# Altium project Main_Board.PrjPcb (part 42 of 44)

## Sheet US_Interrupts.SchDoc
size A3
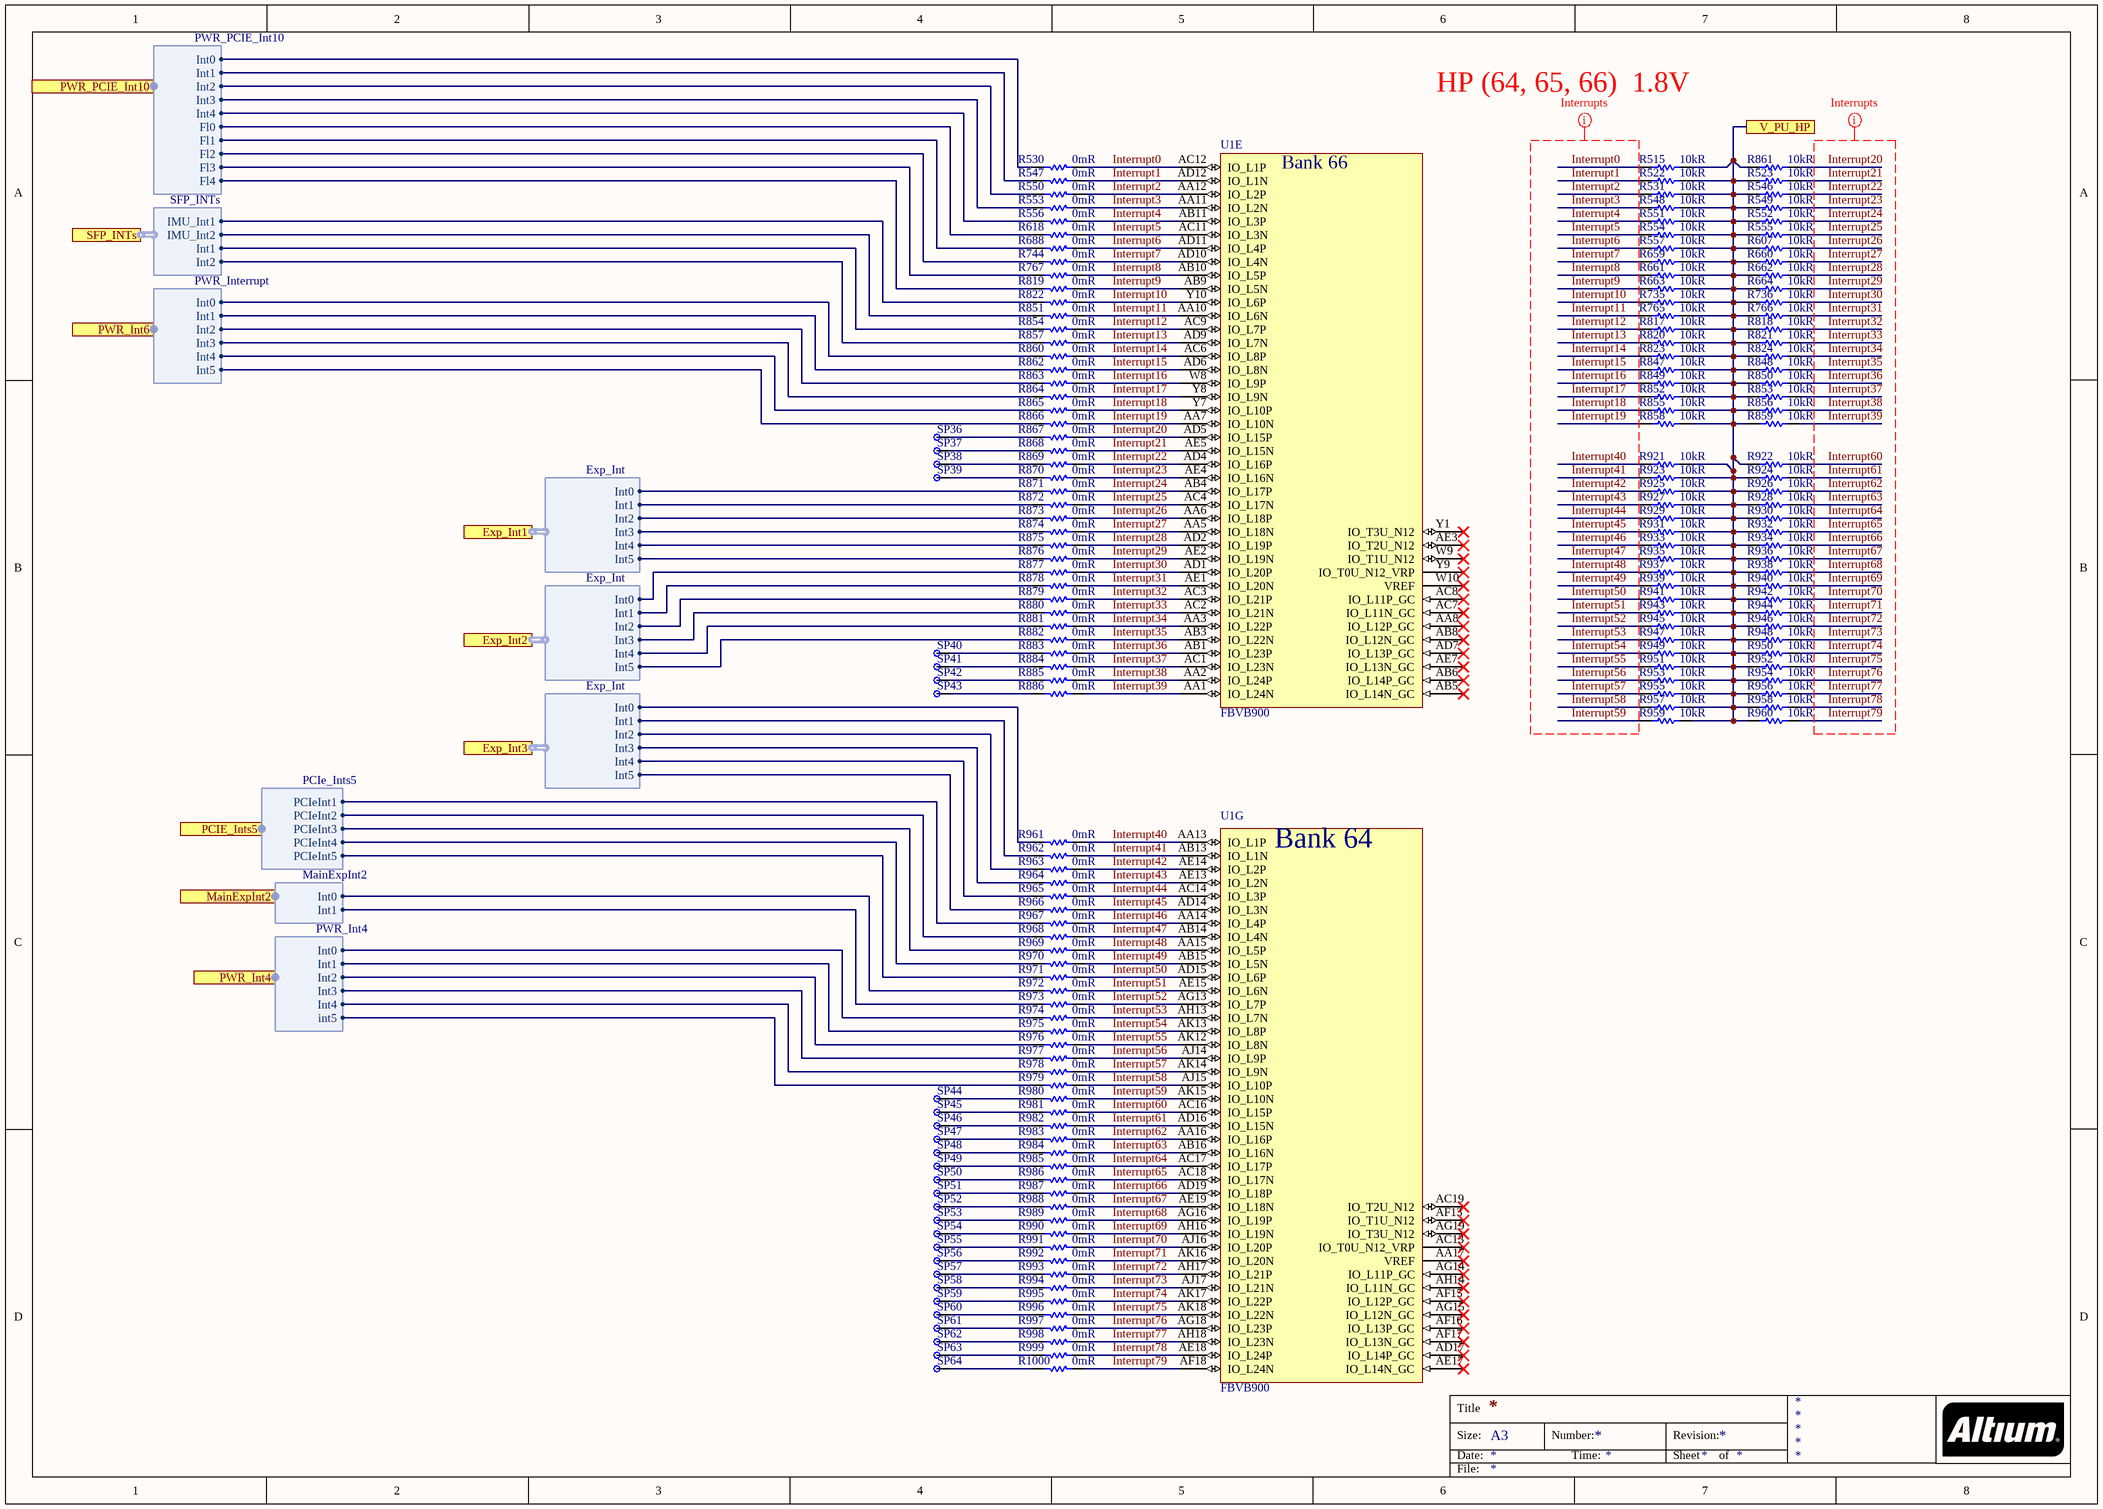
[diagram p69: US_Interrupts.SchDoc]

### Parts
R515  10kR  [RES 0402/1005 RF KK]
R522  10kR  [RES 0402/1005 RF KK]
R523  10kR  [RES 0402/1005 RF KK]
R530  0mR  [RES 0402/1005 RF KK]
R531  10kR  [RES 0402/1005 RF KK]
R546  10kR  [RES 0402/1005 RF KK]
R547  0mR  [RES 0402/1005 RF KK]
R548  10kR  [RES 0402/1005 RF KK]
R549  10kR  [RES 0402/1005 RF KK]
R550  0mR  [RES 0402/1005 RF KK]
R551  10kR  [RES 0402/1005 RF KK]
R552  10kR  [RES 0402/1005 RF KK]
R553  0mR  [RES 0402/1005 RF KK]
R554  10kR  [RES 0402/1005 RF KK]
R555  10kR  [RES 0402/1005 RF KK]
R556  0mR  [RES 0402/1005 RF KK]
R557  10kR  [RES 0402/1005 RF KK]
R607  10kR  [RES 0402/1005 RF KK]
R618  0mR  [RES 0402/1005 RF KK]
R659  10kR  [RES 0402/1005 RF KK]
R660  10kR  [RES 0402/1005 RF KK]
R661  10kR  [RES 0402/1005 RF KK]
R662  10kR  [RES 0402/1005 RF KK]
R663  10kR  [RES 0402/1005 RF KK]
R664  10kR  [RES 0402/1005 RF KK]
R688  0mR  [RES 0402/1005 RF KK]
R735  10kR  [RES 0402/1005 RF KK]
R736  10kR  [RES 0402/1005 RF KK]
R744  0mR  [RES 0402/1005 RF KK]
R765  10kR  [RES 0402/1005 RF KK]
R766  10kR  [RES 0402/1005 RF KK]
R767  0mR  [RES 0402/1005 RF KK]
R817  10kR  [RES 0402/1005 RF KK]
R818  10kR  [RES 0402/1005 RF KK]
R819  0mR  [RES 0402/1005 RF KK]
R820  10kR  [RES 0402/1005 RF KK]
R821  10kR  [RES 0402/1005 RF KK]
R822  0mR  [RES 0402/1005 RF KK]
R823  10kR  [RES 0402/1005 RF KK]
R824  10kR  [RES 0402/1005 RF KK]
R847  10kR  [RES 0402/1005 RF KK]
R848  10kR  [RES 0402/1005 RF KK]
R849  10kR  [RES 0402/1005 RF KK]
R850  10kR  [RES 0402/1005 RF KK]
R851  0mR  [RES 0402/1005 RF KK]
R852  10kR  [RES 0402/1005 RF KK]
R853  10kR  [RES 0402/1005 RF KK]
R854  0mR  [RES 0402/1005 RF KK]
R855  10kR  [RES 0402/1005 RF KK]
R856  10kR  [RES 0402/1005 RF KK]
R857  0mR  [RES 0402/1005 RF KK]
R858  10kR  [RES 0402/1005 RF KK]
R859  10kR  [RES 0402/1005 RF KK]
R860  0mR  [RES 0402/1005 RF KK]
R861  10kR  [RES 0402/1005 RF KK]
R862  0mR  [RES 0402/1005 RF KK]
R863  0mR  [RES 0402/1005 RF KK]
R864  0mR  [RES 0402/1005 RF KK]
R865  0mR  [RES 0402/1005 RF KK]
R866  0mR  [RES 0402/1005 RF KK]
R867  0mR  [RES 0402/1005 RF KK]
R868  0mR  [RES 0402/1005 RF KK]
R869  0mR  [RES 0402/1005 RF KK]
R870  0mR  [RES 0402/1005 RF KK]
R871  0mR  [RES 0402/1005 RF KK]
R872  0mR  [RES 0402/1005 RF KK]
R873  0mR  [RES 0402/1005 RF KK]
R874  0mR  [RES 0402/1005 RF KK]
R875  0mR  [RES 0402/1005 RF KK]
R876  0mR  [RES 0402/1005 RF KK]
R877  0mR  [RES 0402/1005 RF KK]
R878  0mR  [RES 0402/1005 RF KK]
R879  0mR  [RES 0402/1005 RF KK]
R880  0mR  [RES 0402/1005 RF KK]
R881  0mR  [RES 0402/1005 RF KK]
R882  0mR  [RES 0402/1005 RF KK]
R883  0mR  [RES 0402/1005 RF KK]
R884  0mR  [RES 0402/1005 RF KK]
R885  0mR  [RES 0402/1005 RF KK]
R886  0mR  [RES 0402/1005 RF KK]
R921  10kR  [RES 0402/1005 RF KK]
R922  10kR  [RES 0402/1005 RF KK]
R923  10kR  [RES 0402/1005 RF KK]
R924  10kR  [RES 0402/1005 RF KK]
R925  10kR  [RES 0402/1005 RF KK]
R926  10kR  [RES 0402/1005 RF KK]
R927  10kR  [RES 0402/1005 RF KK]
R928  10kR  [RES 0402/1005 RF KK]
R929  10kR  [RES 0402/1005 RF KK]
R930  10kR  [RES 0402/1005 RF KK]
R931  10kR  [RES 0402/1005 RF KK]
R932  10kR  [RES 0402/1005 RF KK]
R933  10kR  [RES 0402/1005 RF KK]
R934  10kR  [RES 0402/1005 RF KK]
R935  10kR  [RES 0402/1005 RF KK]
R936  10kR  [RES 0402/1005 RF KK]
R937  10kR  [RES 0402/1005 RF KK]
R938  10kR  [RES 0402/1005 RF KK]
R939  10kR  [RES 0402/1005 RF KK]
R940  10kR  [RES 0402/1005 RF KK]
R941  10kR  [RES 0402/1005 RF KK]
R942  10kR  [RES 0402/1005 RF KK]
R943  10kR  [RES 0402/1005 RF KK]
R944  10kR  [RES 0402/1005 RF KK]
R945  10kR  [RES 0402/1005 RF KK]
R946  10kR  [RES 0402/1005 RF KK]
R947  10kR  [RES 0402/1005 RF KK]
R948  10kR  [RES 0402/1005 RF KK]
R949  10kR  [RES 0402/1005 RF KK]
R950  10kR  [RES 0402/1005 RF KK]
R951  10kR  [RES 0402/1005 RF KK]
R952  10kR  [RES 0402/1005 RF KK]
R953  10kR  [RES 0402/1005 RF KK]
R954  10kR  [RES 0402/1005 RF KK]
R955  10kR  [RES 0402/1005 RF KK]
R956  10kR  [RES 0402/1005 RF KK]
R957  10kR  [RES 0402/1005 RF KK]
R958  10kR  [RES 0402/1005 RF KK]
R959  10kR  [RES 0402/1005 RF KK]
R960  10kR  [RES 0402/1005 RF KK]
R961  0mR  [RES 0402/1005 RF KK]
R962  0mR  [RES 0402/1005 RF KK]
R963  0mR  [RES 0402/1005 RF KK]
R964  0mR  [RES 0402/1005 RF KK]
R965  0mR  [RES 0402/1005 RF KK]
R966  0mR  [RES 0402/1005 RF KK]
R967  0mR  [RES 0402/1005 RF KK]
R968  0mR  [RES 0402/1005 RF KK]
R969  0mR  [RES 0402/1005 RF KK]
R970  0mR  [RES 0402/1005 RF KK]
R971  0mR  [RES 0402/1005 RF KK]
R972  0mR  [RES 0402/1005 RF KK]
R973  0mR  [RES 0402/1005 RF KK]
R974  0mR  [RES 0402/1005 RF KK]
R975  0mR  [RES 0402/1005 RF KK]
R976  0mR  [RES 0402/1005 RF KK]
R977  0mR  [RES 0402/1005 RF KK]
R978  0mR  [RES 0402/1005 RF KK]
R979  0mR  [RES 0402/1005 RF KK]
R980  0mR  [RES 0402/1005 RF KK]
R981  0mR  [RES 0402/1005 RF KK]
R982  0mR  [RES 0402/1005 RF KK]
R983  0mR  [RES 0402/1005 RF KK]
R984  0mR  [RES 0402/1005 RF KK]
R985  0mR  [RES 0402/1005 RF KK]
R986  0mR  [RES 0402/1005 RF KK]
R987  0mR  [RES 0402/1005 RF KK]
R988  0mR  [RES 0402/1005 RF KK]
R989  0mR  [RES 0402/1005 RF KK]
R990  0mR  [RES 0402/1005 RF KK]
R991  0mR  [RES 0402/1005 RF KK]
R992  0mR  [RES 0402/1005 RF KK]
R993  0mR  [RES 0402/1005 RF KK]
R994  0mR  [RES 0402/1005 RF KK]
R995  0mR  [RES 0402/1005 RF KK]
R996  0mR  [RES 0402/1005 RF KK]
R997  0mR  [RES 0402/1005 RF KK]
R998  0mR  [RES 0402/1005 RF KK]
R999  0mR  [RES 0402/1005 RF KK]
R1000  0mR  [RES 0402/1005 RF KK]
SP36  SP  [MeasureTP]  (value not drawn)
SP37  SP  [MeasureTP]  (value not drawn)
SP38  SP  [MeasureTP]  (value not drawn)
SP39  SP  [MeasureTP]  (value not drawn)
SP40  SP  [MeasureTP]  (value not drawn)
SP41  SP  [MeasureTP]  (value not drawn)
SP42  SP  [MeasureTP]  (value not drawn)
SP43  SP  [MeasureTP]  (value not drawn)
SP44  SP  [MeasureTP]  (value not drawn)
SP45  SP  [MeasureTP]  (value not drawn)
SP46  SP  [MeasureTP]  (value not drawn)
SP47  SP  [MeasureTP]  (value not drawn)
SP48  SP  [MeasureTP]  (value not drawn)
SP49  SP  [MeasureTP]  (value not drawn)
SP50  SP  [MeasureTP]  (value not drawn)
SP51  SP  [MeasureTP]  (value not drawn)
SP52  SP  [MeasureTP]  (value not drawn)
SP53  SP  [MeasureTP]  (value not drawn)
SP54  SP  [MeasureTP]  (value not drawn)
SP55  SP  [MeasureTP]  (value not drawn)
SP56  SP  [MeasureTP]  (value not drawn)
SP57  SP  [MeasureTP]  (value not drawn)
SP58  SP  [MeasureTP]  (value not drawn)
SP59  SP  [MeasureTP]  (value not drawn)
SP60  SP  [MeasureTP]  (value not drawn)
SP61  SP  [MeasureTP]  (value not drawn)
SP62  SP  [MeasureTP]  (value not drawn)
SP63  SP  [MeasureTP]  (value not drawn)
SP64  SP  [MeasureTP]  (value not drawn)
U1  FBVB900  [FBVB900 XX]  (parts E,G of 23)

### Ports
Exp_Int1 (harness Exp_Int), Exp_Int2 (harness Exp_Int), Exp_Int3 (harness Exp_Int), MainExpInt2 (harness MainExpInt2), PCIE_Ints5 (harness PCIe_Ints5), PWR_Int4 (harness PWR_Int4), PWR_Int6 (harness PWR_Interrupt), PWR_PCIE_Int10 (harness PWR_PCIE_Int10), SFP_INTs (harness SFP_INTs), V_PU_HP

### Harnesses
PWR_Interrupt: Int0, Int1, Int2, Int3, Int4, Int5
Exp_Int: Int0, Int1, Int2, Int3, Int4, Int5
PCIe_Ints5: PCIeInt1, PCIeInt2, PCIeInt3, PCIeInt4, PCIeInt5
MainExpInt2: Int0, Int1
PWR_PCIE_Int10: Int0, Int1, Int2, Int3, Int4, Fl0, Fl1, Fl2, Fl3, Fl4
SFP_INTs: IMU_Int1, Int1, Int2, IMU_Int2
PWR_Int4: Int0, Int1, Int2, Int3, Int4, int5

### Nets
Flag_PWRSwitch_PCIE0: R618.2 ; port PWR_PCIE_Int10.Fl0
Flag_PWRSwitch_PCIE1: R688.2 ; port PWR_PCIE_Int10.Fl1
Flag_PWRSwitch_PCIE2: R744.2 ; port PWR_PCIE_Int10.Fl2
Flag_PWRSwitch_PCIE3: R767.2 ; port PWR_PCIE_Int10.Fl3
Flag_PWRSwitch_PCIE4: R819.2 ; port PWR_PCIE_Int10.Fl4
GPIO_Exp10_Int0: R871.2 ; port Exp_Int1.Int0
GPIO_Exp10_Int1: R872.2 ; port Exp_Int1.Int1
GPIO_Exp11_Int0: R873.2 ; port Exp_Int1.Int2
GPIO_Exp11_Int1: R874.2 ; port Exp_Int1.Int3
GPIO_Exp12_Int0: R875.2 ; port Exp_Int1.Int4
GPIO_Exp12_Int1: R876.2 ; port Exp_Int1.Int5
GPIO_Exp13_Int0: R877.2 ; port Exp_Int2.Int0
GPIO_Exp13_Int1: R878.2 ; port Exp_Int2.Int1
GPIO_Exp14_Int0: R879.2 ; port Exp_Int2.Int2
GPIO_Exp14_Int1: R880.2 ; port Exp_Int2.Int3
GPIO_Exp15_Int0: R881.2 ; port Exp_Int2.Int4
GPIO_Exp15_Int1: R882.2 ; port Exp_Int2.Int5
IMU_INT1: R822.2 ; port SFP_INTs.IMU_Int1
IMU_INT2: R851.2 ; port SFP_INTs.IMU_Int2
INTA_EXP_MAIN: R972.2 ; port MainExpInt2.Int0
INTB_EXP_MAIN: R973.2 ; port MainExpInt2.Int1
Interrupt0: R515.2 R530.1 U1.AC12(IO_L1P)
Interrupt1: R522.2 R547.1 U1.AD12(IO_L1N)
Interrupt2: R531.2 R550.1 U1.AA12(IO_L2P)
Interrupt3: R548.2 R553.1 U1.AA11(IO_L2N)
Interrupt4: R551.2 R556.1 U1.AB11(IO_L3P)
Interrupt5: R554.2 R618.1 U1.AC11(IO_L3N)
Interrupt6: R557.2 R688.1 U1.AD11(IO_L4P)
Interrupt7: R659.2 R744.1 U1.AD10(IO_L4N)
Interrupt8: R661.2 R767.1 U1.AB10(IO_L5P)
Interrupt9: R663.2 R819.1 U1.AB9(IO_L5N)
Interrupt10: R735.2 R822.1 U1.Y10(IO_L6P)
Interrupt11: R765.2 R851.1 U1.AA10(IO_L6N)
Interrupt12: R817.2 R854.1 U1.AC9(IO_L7P)
Interrupt13: R820.2 R857.1 U1.AD9(IO_L7N)
Interrupt14: R823.2 R860.1 U1.AC6(IO_L8P)
Interrupt15: R847.2 R862.1 U1.AD6(IO_L8N)
Interrupt16: R849.2 R863.1 U1.W8(IO_L9P)
Interrupt17: R852.2 R864.1 U1.Y8(IO_L9N)
Interrupt18: R855.2 R865.1 U1.Y7(IO_L10P)
Interrupt19: R858.2 R866.1 U1.AA7(IO_L10N)
Interrupt20: R861.1 R867.1 U1.AD5(IO_L15P)
Interrupt21: R523.1 R868.1 U1.AE5(IO_L15N)
Interrupt22: R546.1 R869.1 U1.AD4(IO_L16P)
Interrupt23: R549.1 R870.1 U1.AE4(IO_L16N)
Interrupt24: R552.1 R871.1 U1.AB4(IO_L17P)
Interrupt25: R555.1 R872.1 U1.AC4(IO_L17N)
Interrupt26: R607.1 R873.1 U1.AA6(IO_L18P)
Interrupt27: R660.1 R874.1 U1.AA5(IO_L18N)
Interrupt28: R662.1 R875.1 U1.AD2(IO_L19P)
Interrupt29: R664.1 R876.1 U1.AE2(IO_L19N)
Interrupt30: R736.1 R877.1 U1.AD1(IO_L20P)
Interrupt31: R766.1 R878.1 U1.AE1(IO_L20N)
Interrupt32: R818.1 R879.1 U1.AC3(IO_L21P)
Interrupt33: R821.1 R880.1 U1.AC2(IO_L21N)
Interrupt34: R824.1 R881.1 U1.AA3(IO_L22P)
Interrupt35: R848.1 R882.1 U1.AB3(IO_L22N)
Interrupt36: R850.1 R883.1 U1.AB1(IO_L23P)
Interrupt37: R853.1 R884.1 U1.AC1(IO_L23N)
Interrupt38: R856.1 R885.1 U1.AA2(IO_L24P)
Interrupt39: R859.1 R886.1 U1.AA1(IO_L24N)
Interrupt40: R921.2 R961.1 U1.AA13(IO_L1P)
Interrupt41: R923.2 R962.1 U1.AB13(IO_L1N)
Interrupt42: R925.2 R963.1 U1.AE14(IO_L2P)
Interrupt43: R927.2 R964.1 U1.AE13(IO_L2N)
Interrupt44: R929.2 R965.1 U1.AC14(IO_L3P)
Interrupt45: R931.2 R966.1 U1.AD14(IO_L3N)
Interrupt46: R933.2 R967.1 U1.AA14(IO_L4P)
Interrupt47: R935.2 R968.1 U1.AB14(IO_L4N)
Interrupt48: R937.2 R969.1 U1.AA15(IO_L5P)
Interrupt49: R939.2 R970.1 U1.AB15(IO_L5N)
Interrupt50: R941.2 R971.1 U1.AD15(IO_L6P)
Interrupt51: R943.2 R972.1 U1.AE15(IO_L6N)
Interrupt52: R945.2 R973.1 U1.AG13(IO_L7P)
Interrupt53: R947.2 R974.1 U1.AH13(IO_L7N)
Interrupt54: R949.2 R975.1 U1.AK13(IO_L8P)
Interrupt55: R951.2 R976.1 U1.AK12(IO_L8N)
Interrupt56: R953.2 R977.1 U1.AJ14(IO_L9P)
Interrupt57: R955.2 R978.1 U1.AK14(IO_L9N)
Interrupt58: R957.2 R979.1 U1.AJ15(IO_L10P)
Interrupt59: R959.2 R980.1 U1.AK15(IO_L10N)
Interrupt60: R922.1 R981.1 U1.AC16(IO_L15P)
Interrupt61: R924.1 R982.1 U1.AD16(IO_L15N)
Interrupt62: R926.1 R983.1 U1.AA16(IO_L16P)
Interrupt63: R928.1 R984.1 U1.AB16(IO_L16N)
Interrupt64: R930.1 R985.1 U1.AC17(IO_L17P)
Interrupt65: R932.1 R986.1 U1.AC18(IO_L17N)
Interrupt66: R934.1 R987.1 U1.AD19(IO_L18P)
Interrupt67: R936.1 R988.1 U1.AE19(IO_L18N)
Interrupt68: R938.1 R989.1 U1.AG16(IO_L19P)
Interrupt69: R940.1 R990.1 U1.AH16(IO_L19N)
Interrupt70: R942.1 R991.1 U1.AJ16(IO_L20P)
Interrupt71: R944.1 R992.1 U1.AK16(IO_L20N)
Interrupt72: R946.1 R993.1 U1.AH17(IO_L21P)
Interrupt73: R948.1 R994.1 U1.AJ17(IO_L21N)
Interrupt74: R950.1 R995.1 U1.AK17(IO_L22P)
Interrupt75: R952.1 R996.1 U1.AK18(IO_L22N)
Interrupt76: R954.1 R997.1 U1.AG18(IO_L23P)
Interrupt77: R956.1 R998.1 U1.AH18(IO_L23N)
Interrupt78: R958.1 R999.1 U1.AE18(IO_L24P)
Interrupt79: R960.1 R1000.1 U1.AF18(IO_L24N)
P4HS_PowerAlert_Pcie0: R530.2 ; port PWR_PCIE_Int10.Int0
P4HS_PowerAlert_Pcie1: R547.2 ; port PWR_PCIE_Int10.Int1
P4HS_PowerAlert_Pcie2: R550.2 ; port PWR_PCIE_Int10.Int2
P4HS_PowerAlert_Pcie3: R553.2 ; port PWR_PCIE_Int10.Int3
P4HS_PowerAlert_Pcie4: R556.2 ; port PWR_PCIE_Int10.Int4
PWR_ExtIO_INT0: R977.2 ; port PWR_Int4.Int3
PWR_ExtIO_INT1: R976.2 ; port PWR_Int4.Int2
PWR_ExtIO_INT2: R978.2 ; port PWR_Int4.Int4
PWR_ExtIO_INT3: R979.2 ; port PWR_Int4.int5
PWR_PowerAlert0: R974.2 ; port PWR_Int4.Int0
PWR_PowerAlert1: R975.2 ; port PWR_Int4.Int1
SFP_INT0: R854.2 ; port SFP_INTs.Int1
SFP_INT1: R857.2 ; port SFP_INTs.Int2
US+_MGTVccAux: R515.1 R522.1 R523.2 R531.1 R546.2 R548.1 R549.2 R551.1 R552.2 R554.1 R555.2 R557.1 R607.2 R659.1 R660.2 R661.1 R662.2 R663.1 R664.2 R735.1 R736.2 R765.1 R766.2 R817.1 R818.2 R820.1 R821.2 R823.1 R824.2 R847.1 R848.2 R849.1 R850.2 R852.1 R853.2 R855.1 R856.2 R858.1 R859.2 R861.2 R921.1 R922.2 R923.1 R924.2 R925.1 R926.2 R927.1 R928.2 R929.1 R930.2 R931.1 R932.2 R933.1 R934.2 R935.1 R936.2 R937.1 R938.2 R939.1 R940.2 R941.1 R942.2 R943.1 R944.2 R945.1 R946.2 R947.1 R948.2 R949.1 R950.2 R951.1 R952.2 R953.1 R954.2 R955.1 R956.2 R957.1 R958.2 R959.1 R960.2 ; port V_PU_HP
NetJ1_PCIE0_43: R967.2 ; port PCIE_Ints5.PCIeInt1
NetJ1_PCIE1_43: R968.2 ; port PCIE_Ints5.PCIeInt2
NetJ1_PCIE2_43: R969.2 ; port PCIE_Ints5.PCIeInt3
NetJ1_PCIE3_43: R970.2 ; port PCIE_Ints5.PCIeInt4
NetJ1_PCIE4_43: R971.2 ; port PCIE_Ints5.PCIeInt5
NetR860_2: R860.2 ; port PWR_Int6.Int0
NetR862_2: R862.2 ; port PWR_Int6.Int1
NetR863_2: R863.2 ; port PWR_Int6.Int2
NetR864_2: R864.2 ; port PWR_Int6.Int3
NetR865_2: R865.2 ; port PWR_Int6.Int4
NetR866_2: R866.2 ; port PWR_Int6.Int5
NetR867_2: R867.2 SP36.1
NetR868_2: R868.2 SP37.1
NetR869_2: R869.2 SP38.1
NetR870_2: R870.2 SP39.1
NetR883_2: R883.2 SP40.1
NetR884_2: R884.2 SP41.1
NetR885_2: R885.2 SP42.1
NetR886_2: R886.2 SP43.1
NetR961_2: R961.2 ; port Exp_Int3.Int0
NetR962_2: R962.2 ; port Exp_Int3.Int1
NetR963_2: R963.2 ; port Exp_Int3.Int2
NetR964_2: R964.2 ; port Exp_Int3.Int3
NetR965_2: R965.2 ; port Exp_Int3.Int4
NetR966_2: R966.2 ; port Exp_Int3.Int5
NetR980_2: R980.2 SP44.1
NetR981_2: R981.2 SP45.1
NetR982_2: R982.2 SP46.1
NetR983_2: R983.2 SP47.1
NetR984_2: R984.2 SP48.1
NetR985_2: R985.2 SP49.1
NetR986_2: R986.2 SP50.1
NetR987_2: R987.2 SP51.1
NetR988_2: R988.2 SP52.1
NetR989_2: R989.2 SP53.1
NetR990_2: R990.2 SP54.1
NetR991_2: R991.2 SP55.1
NetR992_2: R992.2 SP56.1
NetR993_2: R993.2 SP57.1
NetR994_2: R994.2 SP58.1
NetR995_2: R995.2 SP59.1
NetR996_2: R996.2 SP60.1
NetR997_2: R997.2 SP61.1
NetR998_2: R998.2 SP62.1
NetR999_2: R999.2 SP63.1
NetR1000_2: R1000.2 SP64.1

Not connected (* = marked no-connect by the designer): U1 AA8(IO_L12P_GC)* AA17(VREF)* AB5(IO_L14N_GC)* AB6(IO_L14P_GC)* AB8(IO_L12N_GC)* AC7(IO_L11N_GC)* AC8(IO_L11P_GC)* AC13(IO_T0U_N12_VRP)* AC19(IO_T2U_N12)* AD7(IO_L13P_GC)* AD17(IO_L14P_GC)* AE3(IO_T2U_N12)* AE7(IO_L13N_GC)* AE17(IO_L14N_GC)* AF13(IO_T1U_N12)* AF15(IO_L12P_GC)* AF16(IO_L13P_GC)* AF17(IO_L13N_GC)* AG14(IO_L11P_GC)* AG15(IO_L12N_GC)* AG19(IO_T3U_N12)* AH14(IO_L11N_GC)* W9(IO_T1U_N12)* W10(VREF)* Y1(IO_T3U_N12)* Y9(IO_T0U_N12_VRP)*

### Layout directives
net class Interrupt_Line: Interrupt0, Interrupt1, Interrupt2, Interrupt3, Interrupt4, Interrupt5, Interrupt6, Interrupt7, Interrupt8, Interrupt9, Interrupt10, Interrupt11, Interrupt12, Interrupt13, Interrupt14, Interrupt15, Interrupt16, Interrupt17, Interrupt18, Interrupt19, Interrupt20, Interrupt21, Interrupt22, Interrupt23, Interrupt24, Interrupt25, Interrupt26, Interrupt27, Interrupt28, Interrupt29, Interrupt30, Interrupt31, Interrupt32, Interrupt33, Interrupt34, Interrupt35, Interrupt36, Interrupt37, Interrupt38, Interrupt39, Interrupt40, Interrupt41, Interrupt42, Interrupt43, Interrupt44, Interrupt45, Interrupt46, Interrupt47, Interrupt48, Interrupt49, Interrupt50, Interrupt51, Interrupt52, Interrupt53, Interrupt54, Interrupt55, Interrupt56, Interrupt57, Interrupt58, Interrupt59, Interrupt60, Interrupt61, Interrupt62, Interrupt63, Interrupt64, Interrupt65, Interrupt66, Interrupt67, Interrupt68, Interrupt69, Interrupt70, Interrupt71, Interrupt72, Interrupt73, Interrupt74, Interrupt75, Interrupt76, Interrupt77, Interrupt78, Interrupt79

### Notes on the sheet
- HP (64, 65, 66)  1.8V
- Title
- Size:
- Date:
- A3
- Number:
- Time:
- Revision:
- Sheet
- of
- File:
- (in symbol FBVB900, part E) Bank 66
- (in symbol FBVB900, part G) Bank 64

### Library data of the parts
R515 R522 R523 R531 R546 R548 R549 R551 R552 R554 R555 R557 R607 R659-R664 R735 R736 R765 R766 R817 R818 R820 R821 R823 R824 R847-R850 R852 R853 R855 R856 R858 R859 R861 R921-R960 = Resistor: as R340 on sheet eMMC; Supplier 1: Digi-Key; Supplier Part Number 1: 311-10.0KLRCT-ND; Stock 1: 71214322; Pricing 1: 1=0,10000, 10=0,01500, 100=0,00600, 1000=0,00270, 2500=0,00235, 5000=0,00194 (USD); RoHS: Yes; Case/Package: 0402; Number of Pins: 2; Case Code (Imperial): 0402; Case Code (Metric): 1005; Min Operating Temperature: -55°C; Max Operating Temperature: 155°C; Resistance: 10kR; Packaging: Tape and Reel; Composition: Thick Film; Voltage Rating (DC): 50V; Termination: SMD/SMT; Military Standard: Not; Working Voltage: 50V; Number of Terminations: 2; Length: 1mm; Height: 0.32mm; Width: 0.5mm; Depth: 0.5mm; Lead Pitch: 0.2mm; REACH SVHC: No SVHC; Lead Free: Lead Free; ComponentLink1URL: https://datasheet.ciiva.com/7660/38568-7660787.pdf?src-supplier=Element14; ComponentLink1Description: https://datasheet.ciiva.com/7660/38568-7660787.pdf?src-supplier=Element14; ComponentLink2URL: https://datasheet.ciiva.com/7849/1784430-7849813.pdf?src-supplier=Element14; ComponentLink2Description: https://datasheet.ciiva.com/7849/1784430-7849813.pdf?src-supplier=Element14; ComponentLink3URL: https://datasheet.ciiva.com/7849/1686128-7849814.pdf?src-supplier=Element14; ComponentLink3Description: https://datasheet.ciiva.com/7849/1686128-7849814.pdf?src-supplier=Element14; ComponentLink4URL: https://datasheet.ciiva.com/7849/1784430-7849815.pdf?src-supplier=Element14; ComponentLink4Description: https://datasheet.ciiva.com/7849/1784430-7849815.pdf?src-supplier=Element14; ComponentLink5URL: https://datasheet.ciiva.com/22747/1018594-22747512.pdf?src-supplier=Element14; ComponentLink5Description: https://datasheet.ciiva.com/22747/1018594-22747512.pdf?src-supplier=Element14; ComponentLink6URL: https://datasheet.ciiva.com/12667/pyu-rc0402-51-rohs-l-6-r-12667067.pdf?src-supplier=Mouser; ComponentLink6Description: https://datasheet.ciiva.com/12667/pyu-rc0402-51-rohs-l-6-r-12667067.pdf?src-supplier=Mouser; ComponentLink7URL: https://datasheet.ciiva.com/7983/1018594-7983486.pdf?src-supplier=Element14; ComponentLink7Description: https://datasheet.ciiva.com/7983/1018594-7983486.pdf?src-supplier=Element14
R530 R547 R550 R553 R556 R618 R688 R744 R767 R819 R822 R851 R854 R857 R860 R862-R886 R961-R1000 = Resistor: as R345 on sheet eMMC; Supplier 1: Digi-Key; Supplier Part Number 1: 311-0.0JRCT-ND; Stock 1: 69822252; Pricing 1: 1=0.10000, 10=0.01200, 25=0.00920, 50=0.00680, 100=0.00510, 250=0.00388, 500=0.00308, 1000=0.00227, 5000=0.00163 (USD); RoHS: Yes; Case/Package: 0402; Contact Plating: Tin,Matte; Case Code (Metric): 1005; Case Code (Imperial): 0402; Min Operating Temperature: -55°C; Max Operating Temperature: 155°C; Resistance: 0mR; Packaging: Tape and Reel; Composition: Thick Film; Package Quantity: 1; Number of Terminations: 2; Termination: SMD/SMT; Military Standard: Not; Features: Moisture Resistant; Length: 1mm; Height: 0.016inch; Width: 0.02inch; Depth: 0.5mm; Radiation Hardening: No; REACH SVHC: Unknown; Lead Free: Lead Free; ComponentLink1URL: https://datasheet.ciiva.com/2452/pyu-rc0402-51-rohs-l-6-2452608.pdf?src-supplier=Digi-Key; ComponentLink1Description: https://datasheet.ciiva.com/2452/pyu-rc0402-51-rohs-l-6-2452608.pdf?src-supplier=Digi-Key; ComponentLink2URL: https://datasheet.ciiva.com/11808/0900766b80c66297-11808195.pdf?src-supplier=RSComponents; ComponentLink2Description: https://datasheet.ciiva.com/11808/0900766b80c66297-11808195.pdf?src-supplier=RSComponents; ComponentLink3URL: https://datasheet.ciiva.com/2452/pyu-r-int-thick-7-2452609.pdf?src-supplier=Digi-Key; ComponentLink3Description: https://datasheet.ciiva.com/2452/pyu-r-int-thick-7-2452609.pdf?src-supplier=Digi-Key; ComponentLink4URL: https://datasheet.ciiva.com/22747/1018594-22747515.pdf?src-supplier=Element14; ComponentLink4Description: https://datasheet.ciiva.com/22747/1018594-22747515.pdf?src-supplier=Element14; ComponentLink5URL: https://datasheet.ciiva.com/7983/1018594-7983535.pdf?src-supplier=Element14; ComponentLink5Description: https://datasheet.ciiva.com/7983/1018594-7983535.pdf?src-supplier=Element14; ComponentLink6URL: https://datasheet.ciiva.com/2452/pyu-r-int-thick-7-2452610.pdf?src-supplier=Digi-Key; ComponentLink6Description: https://datasheet.ciiva.com/2452/pyu-r-int-thick-7-2452610.pdf?src-supplier=Digi-Key; ComponentLink7URL: https://datasheet.ciiva.com/8896/pyu-rc0402-51-rohs-l-6-8896201.pdf?src-supplier=Avnet; ComponentLink7Description: https://datasheet.ciiva.com/8896/pyu-rc0402-51-rohs-l-6-8896201.pdf?src-supplier=Avnet; ComponentLink8URL: https://datasheet.ciiva.com/28386/pyu-rc0402-51-rohs-l-6-28386633.pdf?src-supplier=Avnet+Europe; ComponentLink8Description: https://datasheet.ciiva.com/28386/pyu-rc0402-51-rohs-l-6-28386633.pdf?src-supplier=Avnet+Europe; ComponentLink9URL: https://datasheet.ciiva.com/15189/getdatasheetpartid-326379-15189533.pdf?src-supplier=Verical; ComponentLink9Description: https://datasheet.ciiva.com/15189/getdatasheetpartid-326379-15189533.pdf?src-supplier=Verical
U1 = FBVB900: as U1 on sheet GTR; Supplier 1: Mouser; Supplier Part Number 1: 217-CZU4CG-1FBVB900E; Stock 1: 3; Pricing 1: 1=0,00000, 5=1060,70000 (USD); RoHS: No; Case/Package: FCBGA; Min Operating Temperature: 0°C; Max Operating Temperature: 100°C; Packaging: Tray; ComponentLink1URL: https://www.xilinx.com/support/documentation/data_sheets/ds891-zynq-ultrascale-plus-overview.pdf?src-supplier=Digi-Key; ComponentLink1Description: https://www.xilinx.com/support/documentation/data_sheets/ds891-zynq-ultrascale-plus-overview.pdf?src-supplier=Digi-Key; ComponentLink2URL: https://www.xilinx.com/support/documentation/data_sheets/ds925-zynq-ultrascale-plus.pdf?src-supplier=Digi-Key; ComponentLink2Description: https://www.xilinx.com/support/documentation/data_sheets/ds925-zynq-ultrascale-plus.pdf?src-supplier=Digi-Key; Supplier 2: Avnet; Supplier 3: Digi-Key; Supplier Part Number 2: XCZU4CG-1FBVB900E; Supplier Part Number 3: XCZU4CG-1FBVB900E-ND